# Altium project FluxWhisper.PrjPcb
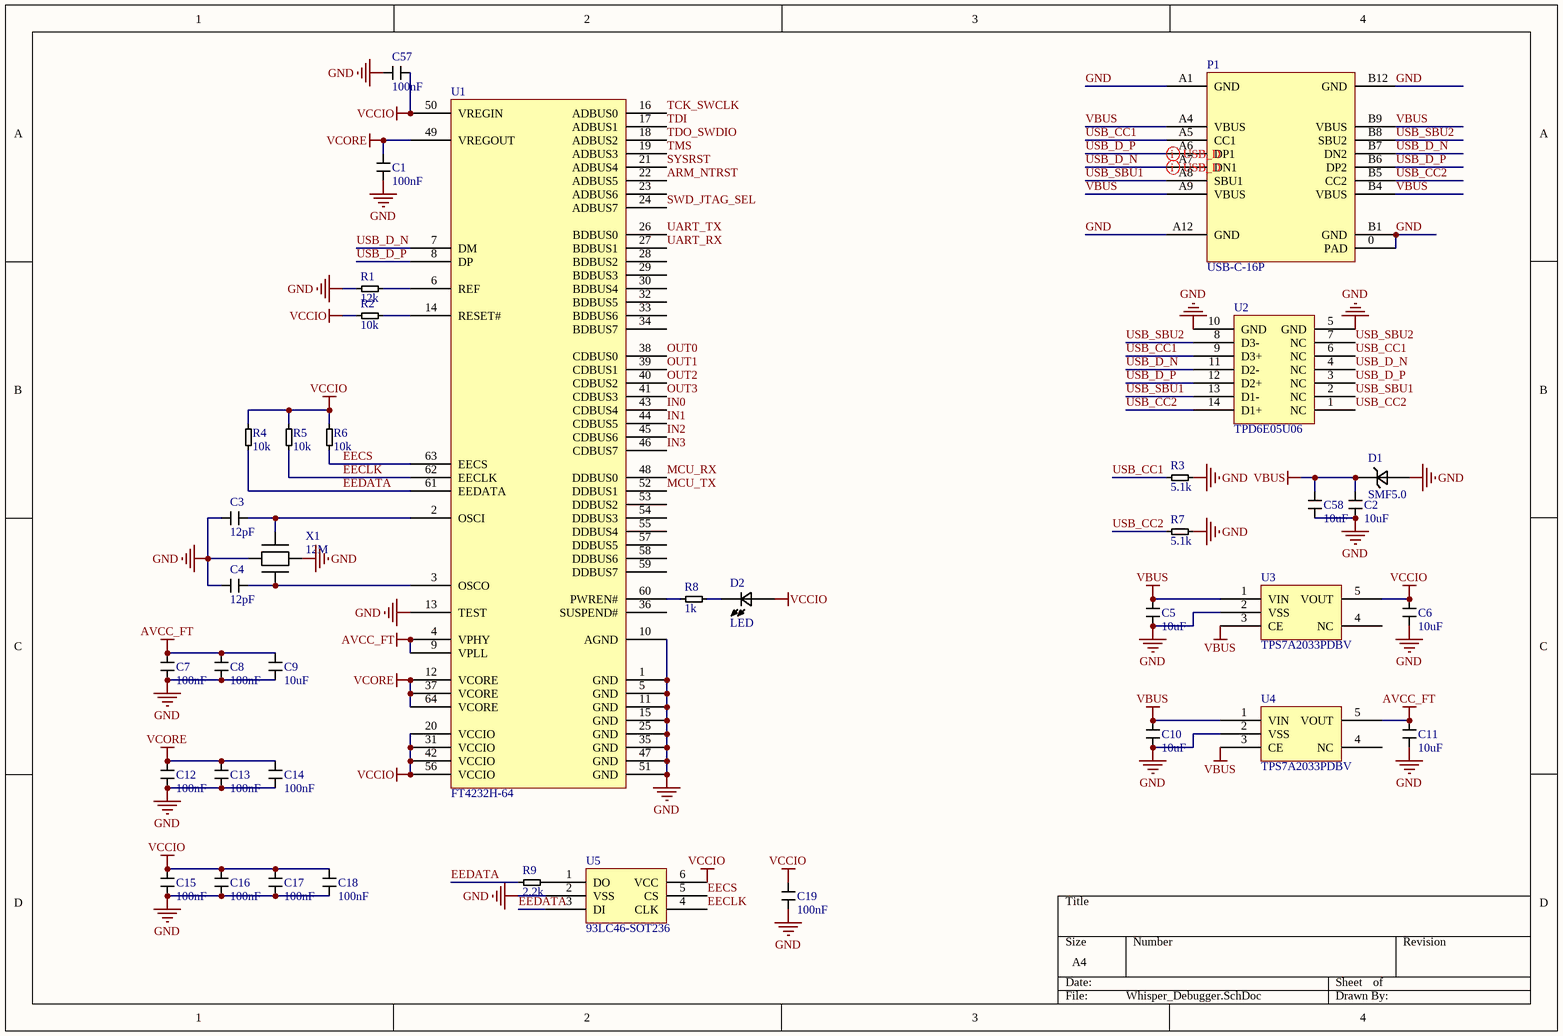
[diagram p0: Whisper_Debugger.SchDoc]
4 sheets, 209 parts. Net scope: global (net labels, ports and power ports of the same name join across sheets).
Board file: Whisper_pcb.PcbDoc
Sheets:
  Whisper_Debugger.SchDoc
  Whisper_Power.SchDoc
  Whisper_MCU.SchDoc
  Whisper_Ports.SchDoc

## Sheet Whisper_Debugger.SchDoc
size A4; SheetNumber: 1; SheetTotal: 4

### Parts
C1  100nF  [0603-Cap]
C2  10uF  [0603-Cap]
C3  12pF  [0603-Cap]
C4  12pF  [0603-Cap]
C5  10uF  [0603-Cap]
C6  10uF  [0603-Cap]
C7  100nF  [0603-Cap]
C8  100nF  [0603-Cap]
C9  10uF  [0603-Cap]
C10  10uF  [0603-Cap]
C11  10uF  [0603-Cap]
C12  100nF  [0603-Cap]
C13  100nF  [0603-Cap]
C14  100nF  [0603-Cap]
C15  100nF  [0603-Cap]
C16  100nF  [0603-Cap]
C17  100nF  [0603-Cap]
C18  100nF  [0603-Cap]
C19  100nF  [0603-Cap]
C57  100nF  [0603-Cap]
C58  10uF  [0603-Cap]
D1  SMF5.0  [SOD-123]
D2  LED  [0603-1]
P1  USB-C-16P  [USB-C-16P]
R1  12k  [0603]
R2  10k  [0603]
R3  5.1k  [0603]
R4  10k  [0603]
R5  10k  [0603]
R6  10k  [0603]
R7  5.1k  [0603]
R8  1k  [0603]
R9  2.2k  [0603]
U1  FT4232H-64  [LQFP-64]
U2  TPD6E05U06  [SON-14-RVZ]
U3  TPS7A2033PDBV  [SOT23-5]
U4  TPS7A2033PDBV  [SOT23-5]
U5  93LC46-SOT236  [SOT236]
X1  12M  [XTAL-3225-4P]

### Nets
AVCC_FT: C7.2 C8.2 C9.2 C11.2 U1.4(VPHY) U1.9(VPLL) U4.5(VOUT)
GND: C1.1 C2.1 C3.2 C4.2 C5.1 C6.1 C7.1 C8.1 C9.1 C10.1 C11.1 C12.1 C13.1 C14.1 C15.1 C16.1 C17.1 C18.1 C19.1 C57.2 C58.1 D1.1 P1.0(PAD) P1.A1(GND) P1.A12(GND) P1.B1(GND) P1.B12(GND) R1.2 R3.1 R7.1 U1.1(GND) U1.5(GND) U1.10(AGND) U1.11(GND) U1.13(TEST) U1.15(GND) U1.25(GND) U1.35(GND) U1.47(GND) U1.51(GND) U2.5(GND) U2.10(GND) U3.2(VSS) U4.2(VSS) U5.2(VSS) X1.2 X1.4
VBUS: C2.2 C5.2 C10.2 C58.2 D1.2 P1.A4(VBUS) P1.A9(VBUS) P1.B4(VBUS) P1.B9(VBUS) U3.1(VIN) U3.3(CE) U4.1(VIN) U4.3(CE)
VCCIO: C6.2 C15.2 C16.2 C17.2 C18.2 C19.2 C57.1 D2.1 R2.2 R4.1 R5.1 R6.1 U1.20(VCCIO) U1.31(VCCIO) U1.42(VCCIO) U1.50(VREGIN) U1.56(VCCIO) U3.5(VOUT) U5.6(VCC)
VCORE: C1.2 C12.2 C13.2 C14.2 U1.12(VCORE) U1.37(VCORE) U1.49(VREGOUT) U1.64(VCORE)
ARM_NTRST: U1.22(ADBUS5)
EECLK: R5.2 U1.62(EECLK) U5.4(CLK)
EECS: R6.2 U1.63(EECS) U5.5(CS)
EEDATA: R4.2 R9.2 U1.61(EEDATA) U5.3(DI)
IN0: U1.43(CDBUS4)
IN1: U1.44(CDBUS5)
IN2: U1.45(CDBUS6)
IN3: U1.46(CDBUS7)
MCU_RX: U1.48(DDBUS0)
MCU_TX: U1.52(DDBUS1)
OUT0: U1.38(CDBUS0)
OUT1: U1.39(CDBUS1)
OUT2: U1.40(CDBUS2)
OUT3: U1.41(CDBUS3)
SWD_JTAG_SEL: U1.24(ADBUS7)
SYSRST: U1.21(ADBUS4)
TCK_SWCLK: U1.16(ADBUS0)
TDI: U1.17(ADBUS1)
TDO_SWDIO: U1.18(ADBUS2)
TMS: U1.19(ADBUS3)
UART_RX: U1.27(BDBUS1)
UART_TX: U1.26(BDBUS0)
USB_CC1: P1.A5(CC1) R3.2 U2.6(NC) U2.9(D3+)
USB_CC2: P1.B5(CC2) R7.2 U2.1(NC) U2.14(D1+)
USB_D_N: P1.A7(DN1) P1.B7(DN2) U1.7(DM) U2.4(NC) U2.11(D2-)
USB_D_P: P1.A6(DP1) P1.B6(DP2) U1.8(DP) U2.3(NC) U2.12(D2+)
USB_SBU1: P1.A8(SBU1) U2.2(NC) U2.13(D1-)
USB_SBU2: P1.B8(SBU2) U2.7(NC) U2.8(D3-)
NetC3_1: C3.1 U1.2(OSCI) X1.3
NetC4_1: C4.1 U1.3(OSCO) X1.1
NetD2_2: D2.2 R8.1
NetR1_1: R1.1 U1.6(REF)
NetR2_1: R2.1 U1.14(RESET#)
NetR8_2: R8.2 U1.60(PWREN#)
NetR9_1: R9.1 U5.1(DO)

Not connected (* = marked no-connect by the designer): U1 23(ADBUS6) 28(BDBUS2) 29(BDBUS3) 30(BDBUS4) 32(BDBUS5) 33(BDBUS6) 34(BDBUS7) 36(SUSPEND#) 53(DDBUS2) 54(DDBUS3) 55(DDBUS4) 57(DDBUS5) 58(DDBUS6) 59(DDBUS7); U3 4(NC); U4 4(NC)

### Layout directives
differential pair: USB_D_N, USB_D_P

### Library data of the parts
C1-C4 C7-C9 C12-C19 C57 C58 = Cap
C5 C6 C10 C11 = Cap: CL10A475KA8NQNC
D1 = TVS
P1 = USB-C-16P: TYPE-C 16PIN 2MD(073)
R1-R9 = Res
U2 = TPD6E
U3 U4 = ME6211
X1 = XTAL-4LEAD

## Sheet Whisper_Power.SchDoc
size A4; SheetNumber: 2; SheetTotal: 4
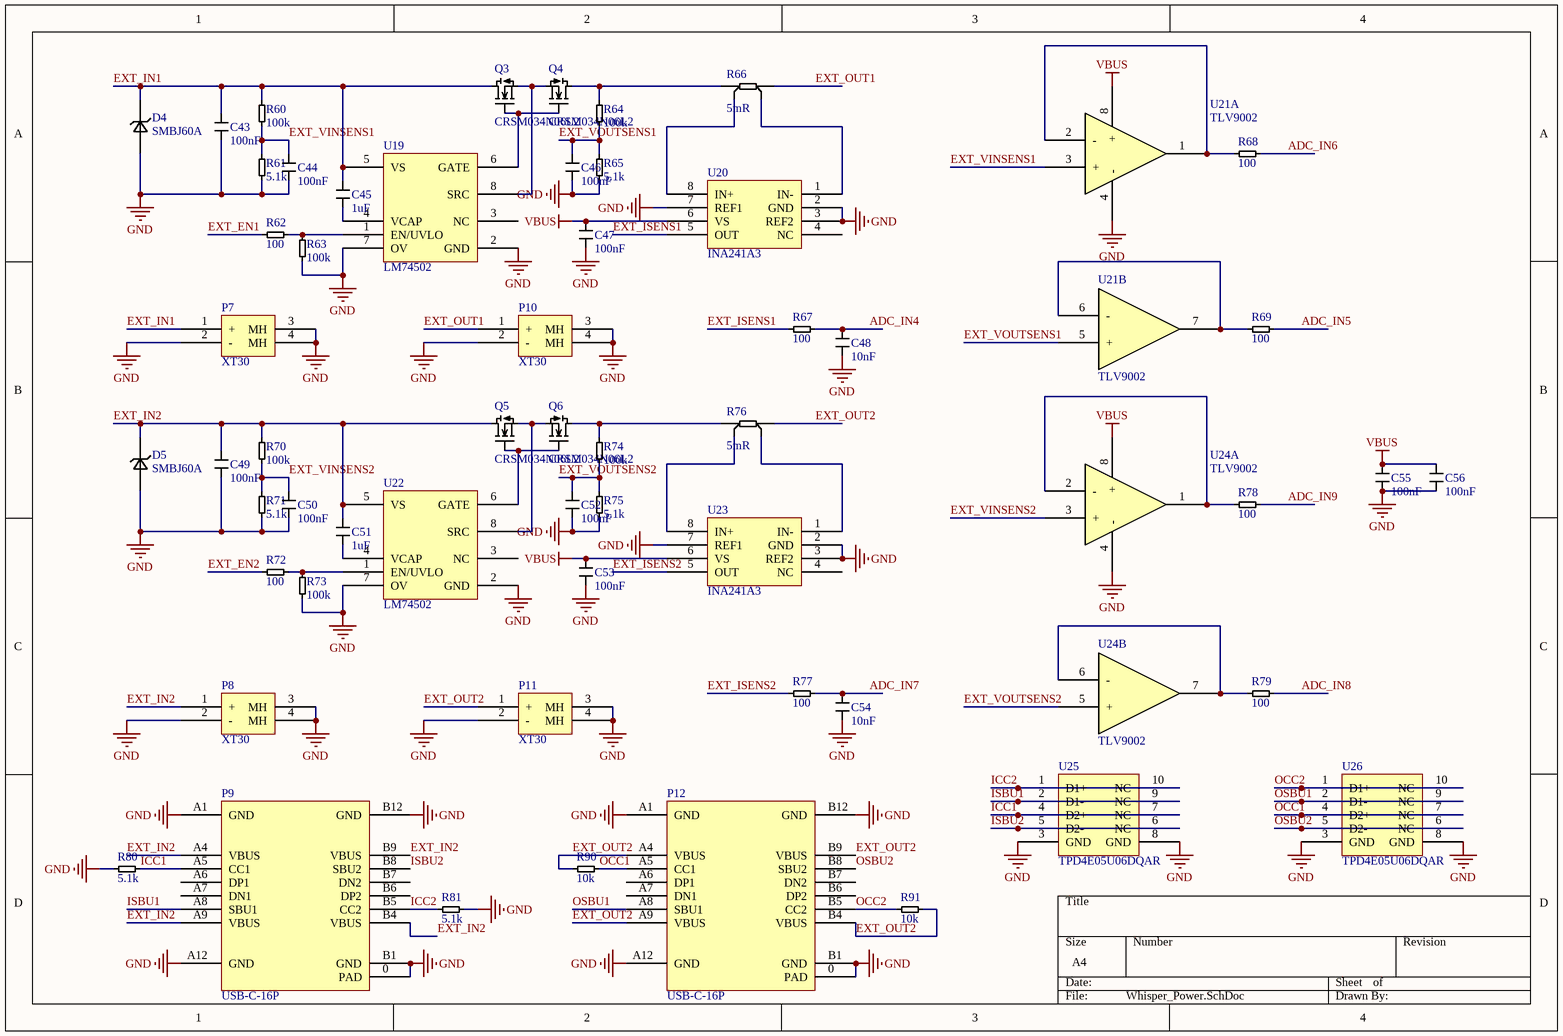
[diagram p1: Whisper_Power.SchDoc]

### Parts
C43  100nF  [0603-Cap]
C44  100nF  [0603-Cap]
C45  1uF  [0603-Cap]
C46  100nF  [0603-Cap]
C47  100nF  [0603-Cap]
C48  10nF  [0603-Cap]
C49  100nF  [0603-Cap]
C50  100nF  [0603-Cap]
C51  1uF  [0603-Cap]
C52  100nF  [0603-Cap]
C53  100nF  [0603-Cap]
C54  10nF  [0603-Cap]
C55  100nF  [0603-Cap]
C56  100nF  [0603-Cap]
D4  SMBJ60A  [SMB (DO-214AA)]
D5  SMBJ60A  [SMB (DO-214AA)]
P7  XT30  [XT30PW-M30]
P8  XT30  [XT30PW-M30]
P9  USB-C-16P  [USB-C-16P]
P10  XT30  [XT30PW-F30]
P11  XT30  [XT30PW-F30]
P12  USB-C-16P  [USB-C-16P]
Q3  CRSM034N06L2  [DFN5x6-MOS]
Q4  CRSM034N06L2  [DFN5x6-MOS]
Q5  CRSM034N06L2  [DFN5x6-MOS]
Q6  CRSM034N06L2  [DFN5x6-MOS]
R60  100k  [0603]
R61  5.1k  [0603]
R62  100  [0603]
R63  100k  [0603]
R64  100k  [0603]
R65  5.1k  [0603]
R66  5mR  [2512 - 4W]
R67  100  [0603]
R68  100  [0603]
R69  100  [0603]
R70  100k  [0603]
R71  5.1k  [0603]
R72  100  [0603]
R73  100k  [0603]
R74  100k  [0603]
R75  5.1k  [0603]
R76  5mR  [2512 - 4W]
R77  100  [0603]
R78  100  [0603]
R79  100  [0603]
R80  5.1k  [0603]
R81  5.1k  [0603]
R90  10k  [0603]
R91  10k  [0603]
U19  LM74502  [SOT23-8]
U20  INA241A3  [SOT23-8]
U21  TLV9002  [MSOP8]  (parts A,B of 2)
U22  LM74502  [SOT23-8]
U23  INA241A3  [SOT23-8]
U24  TLV9002  [MSOP8]  (parts A,B of 2)
U25  TPD4E05U06DQAR  [SON-10-DQA]
U26  TPD4E05U06DQAR  [SON-10-DQA]

### Nets
GND: C43.1 C44.1 C46.1 C47.1 C48.1 C49.1 C50.1 C52.1 C53.1 C54.1 C55.1 C56.1 D4.1 D5.1 P7.2(-) P7.3(MH) P7.4(MH) P8.2(-) P8.3(MH) P8.4(MH) P9.0(PAD) P9.A1(GND) P9.A12(GND) P9.B1(GND) P9.B12(GND) P10.2(-) P10.3(MH) P10.4(MH) P11.2(-) P11.3(MH) P11.4(MH) P12.0(PAD) P12.A1(GND) P12.A12(GND) P12.B1(GND) P12.B12(GND) R61.2 R63.2 R65.2 R71.2 R73.2 R75.2 R80.1 R81.1 U19.2(GND) U19.7(OV) U20.2(GND) U20.3(REF2) U20.7(REF1) U21.4(-) U22.2(GND) U22.7(OV) U23.2(GND) U23.3(REF2) U23.7(REF1) U24.4(-) U25.3(GND) U25.8(GND) U26.3(GND) U26.8(GND)
VBUS: C47.2 C53.2 C55.2 C56.2 U20.6(VS) U21.8(+) U23.6(VS) U24.8(+)
ADC_IN4: C48.2 R67.1
ADC_IN5: R69.1
ADC_IN6: R68.1
ADC_IN7: C54.2 R77.1
ADC_IN8: R79.1
ADC_IN9: R78.1
EXT_EN1: R62.1
EXT_EN2: R72.1
EXT_IN1: C43.2 C45.2 D4.2 P7.1(+) Q3.3(D) R60.1 U19.5(VS)
EXT_IN2: C49.2 C51.2 D5.2 P8.1(+) P9.A4(VBUS) P9.A9(VBUS) P9.B4(VBUS) P9.B9(VBUS) Q5.3(D) R70.1 U22.5(VS)
EXT_ISENS1: R67.2 U20.5(OUT)
EXT_ISENS2: R77.2 U23.5(OUT)
EXT_OUT1: P10.1(+) R66.2
EXT_OUT2: P11.1(+) P12.A4(VBUS) P12.A9(VBUS) P12.B4(VBUS) P12.B9(VBUS) R76.2 R90.2 R91.1
EXT_VINSENS1: C44.2 R60.2 R61.1 U21.3(+)
EXT_VINSENS2: C50.2 R70.2 R71.1 U24.3(+)
EXT_VOUTSENS1: C46.2 R64.2 R65.1 U21.5(+)
EXT_VOUTSENS2: C52.2 R74.2 R75.1 U24.5(+)
ICC1: P9.A5(CC1) R80.2 U25.4(D2+) U25.7(NC)
ICC2: P9.B5(CC2) R81.2 U25.1(D1+) U25.10(NC)
ISBU1: P9.A8(SBU1) U25.2(D1-) U25.9(NC)
ISBU2: P9.B8(SBU2) U25.5(D2-) U25.6(NC)
OCC1: P12.A5(CC1) R90.1 U26.4(D2+) U26.7(NC)
OCC2: P12.B5(CC2) R91.2 U26.1(D1+) U26.10(NC)
OSBU1: P12.A8(SBU1) U26.2(D1-) U26.9(NC)
OSBU2: P12.B8(SBU2) U26.5(D2-) U26.6(NC)
NetC45_1: C45.1 U19.4(VCAP)
NetC51_1: C51.1 U22.4(VCAP)
NetQ3_1: Q3.1(G) Q4.1(G) U19.6(GATE)
NetQ3_2: Q3.2(S) Q4.2(S) U19.8(SRC)
NetQ4_3: Q4.3(D) R64.1 R66.1
NetQ5_1: Q5.1(G) Q6.1(G) U22.6(GATE)
NetQ5_2: Q5.2(S) Q6.2(S) U22.8(SRC)
NetQ6_3: Q6.3(D) R74.1 R76.1
NetR62_2: R62.2 R63.1 U19.1(EN/UVLO)
NetR66_3: R66.3 U20.8(IN+)
NetR66_4: R66.4 U20.1(IN-)
NetR68_2: R68.2 U21.1 U21.2(-)
NetR69_2: R69.2 U21.6(-) U21.7
NetR72_2: R72.2 R73.1 U22.1(EN/UVLO)
NetR76_3: R76.3 U23.8(IN+)
NetR76_4: R76.4 U23.1(IN-)
NetR78_2: R78.2 U24.1 U24.2(-)
NetR79_2: R79.2 U24.6(-) U24.7

Not connected (* = marked no-connect by the designer): P9 A6(DP1) A7(DN1) B6(DP2) B7(DN2); P12 A6(DP1) A7(DN1) B6(DP2) B7(DN2); U19 3(NC); U20 4(NC); U22 3(NC); U23 4(NC)

### Library data of the parts
C43-C56 = Cap
D4 D5 = TVS
P9 P12 = USB-C-16P: TYPE-C 16PIN 2MD(073)
Q3-Q6 = NMOS-D: C467174
R60-R65 R67-R75 R77-R81 R90 R91 = Res
R66 R76 = RES-4W
U20 U23 = INA241
U21 U24 = ADA4077-2
U25 U26 = TPD4E

## Sheet Whisper_MCU.SchDoc
size A4; SheetNumber: 3; SheetTotal: 4
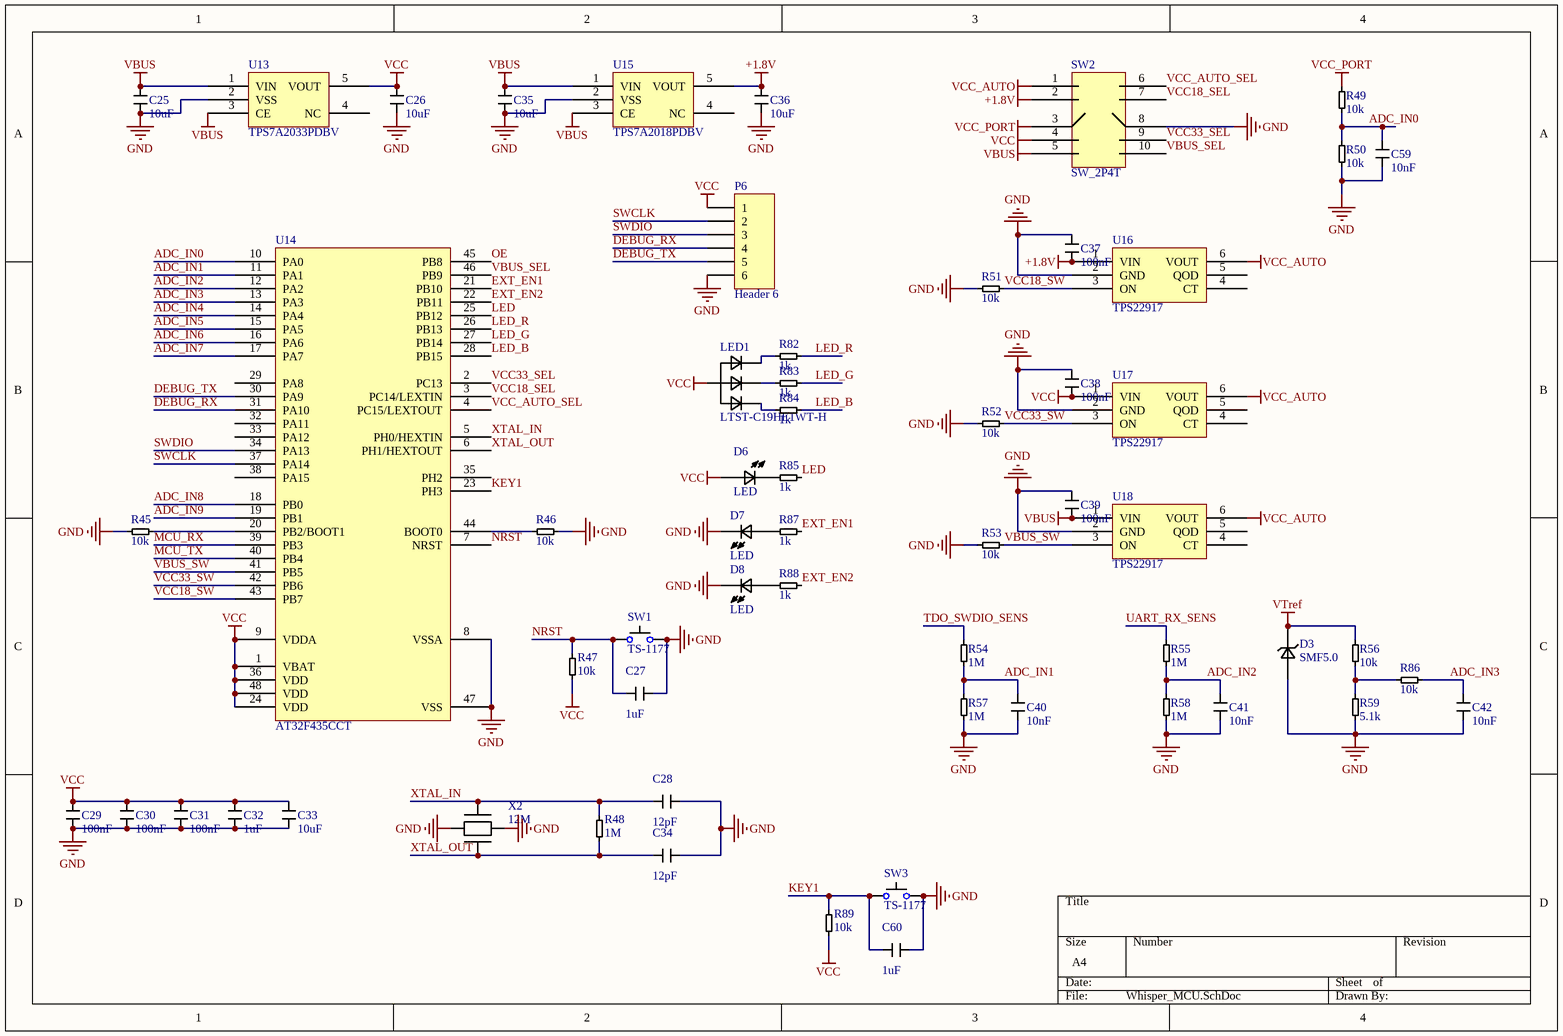
[diagram p2: Whisper_MCU.SchDoc]

### Parts
C25  10uF  [0603-Cap]
C26  10uF  [0603-Cap]
C27  1uF  [0603-Cap]
C28  12pF  [0603-Cap]
C29  100nF  [0603-Cap]
C30  100nF  [0603-Cap]
C31  100nF  [0603-Cap]
C32  1uF  [0603-Cap]
C33  10uF  [0603-Cap]
C34  12pF  [0603-Cap]
C35  10uF  [0603-Cap]
C36  10uF  [0603-Cap]
C37  100nF  [0603-Cap]
C38  100nF  [0603-Cap]
C39  100nF  [0603-Cap]
C40  10nF  [0603-Cap]
C41  10nF  [0603-Cap]
C42  10nF  [0603-Cap]
C59  10nF  [0603-Cap]
C60  1uF  [0603-Cap]
D3  SMF5.0  [SOD-123]
D6  LED  [0603-1]
D7  LED  [0603-1]
D8  LED  [0603-1]
LED1  LTST-C19HE1WT-H  [RGB1.6*1.6]
P6  Header 6  [HDR1X6]
R45  10k  [0603]
R46  10k  [0603]
R47  10k  [0603]
R48  1M  [0603]
R49  10k  [0603]
R50  10k  [0603]
R51  10k  [0603]
R52  10k  [0603]
R53  10k  [0603]
R54  1M  [0603]
R55  1M  [0603]
R56  10k  [0603]
R57  1M  [0603]
R58  1M  [0603]
R59  5.1k  [0603]
R82  1k  [0603]
R83  1k  [0603]
R84  1k  [0603]
R85  1k  [0603]
R86  10k  [0603]
R87  1k  [0603]
R88  1k  [0603]
R89  10k  [0603]
SW1  TS-1177  [BTN3*3]
SW2  SW_2P4T  [SW-SS-3456S-02-L1]
SW3  TS-1177  [BTN3*3]
U13  TPS7A2033PDBV  [SOT23-5]
U14  AT32F435CCT  [LQFP-48]
U15  TPS7A2018PDBV  [SOT23-5]
U16  TPS22917  [SOT236]
U17  TPS22917  [SOT236]
U18  TPS22917  [SOT236]
X2  12M  [XTAL-3225-4P]

### Nets
+1.8V: C36.2 C37.1 SW2.2 U15.5(VOUT) U16.1(VIN)
GND: C25.1 C26.1 C27.1 C28.1 C29.1 C30.1 C31.1 C32.1 C33.1 C34.1 C35.1 C36.1 C37.2 C38.2 C39.2 C40.2 C41.2 C42.2 C59.2 C60.1 D3.1 D7.2 D8.2 P6.6 R45.2 R46.2 R50.1 R51.2 R52.2 R53.2 R57.1 R58.1 R59.1 SW1.2 SW2.8 SW3.2 U13.2(VSS) U14.8(VSSA) U14.47(VSS) U15.2(VSS) U16.2(GND) U17.2(GND) U18.2(GND) X2.2 X2.4
VBUS: C25.2 C35.2 C39.1 SW2.5 U13.1(VIN) U13.3(CE) U15.1(VIN) U15.3(CE) U18.1(VIN)
VCC: C26.2 C29.2 C30.2 C31.2 C32.2 C33.2 C38.1 D6.1 LED1.4 P6.1 R47.1 R89.1 SW2.4 U13.5(VOUT) U14.1(VBAT) U14.9(VDDA) U14.24(VDD) U14.36(VDD) U14.48(VDD) U17.1(VIN)
VCC_AUTO: SW2.1 U16.6(VOUT) U17.6(VOUT) U18.6(VOUT)
VCC_PORT: R49.2 SW2.3
VTref: D3.2 R56.2
ADC_IN0: C59.1 R49.1 R50.2 U14.10(PA0)
ADC_IN1: C40.1 R54.1 R57.2 U14.11(PA1)
ADC_IN2: C41.1 R55.1 R58.2 U14.12(PA2)
ADC_IN3: C42.1 R86.1 U14.13(PA3)
ADC_IN4: U14.14(PA4)
ADC_IN5: U14.15(PA5)
ADC_IN6: U14.16(PA6)
ADC_IN7: U14.17(PA7)
ADC_IN8: U14.18(PB0)
ADC_IN9: U14.19(PB1)
DEBUG_RX: P6.4 U14.31(PA10)
DEBUG_TX: P6.5 U14.30(PA9)
EXT_EN1: R87.2 U14.21(PB10)
EXT_EN2: R88.2 U14.22(PB11)
KEY1: C60.2 R89.2 SW3.1 U14.23(PH3)
LED: R85.2 U14.25(PB12)
LED_B: R84.2 U14.28(PB15)
LED_G: R83.2 U14.27(PB14)
LED_R: R82.2 U14.26(PB13)
MCU_RX: U14.39(PB3)
MCU_TX: U14.40(PB4)
NRST: C27.2 R47.2 SW1.1 U14.7(NRST)
OE: U14.45(PB8)
SWCLK: P6.2 U14.37(PA14)
SWDIO: P6.3 U14.34(PA13)
TDO_SWDIO_SENS: R54.2
UART_RX_SENS: R55.2
VBUS_SEL: SW2.10 U14.46(PB9)
VBUS_SW: R53.1 U14.41(PB5) U18.3(ON)
VCC18_SEL: SW2.7 U14.3(PC14/LEXTIN)
VCC18_SW: R51.1 U14.43(PB7) U16.3(ON)
VCC33_SEL: SW2.9 U14.2(PC13)
VCC33_SW: R52.1 U14.42(PB6) U17.3(ON)
VCC_AUTO_SEL: SW2.6 U14.4(PC15/LEXTOUT)
XTAL_IN: C28.2 R48.2 U14.5(PH0/HEXTIN) X2.3
XTAL_OUT: C34.2 R48.1 U14.6(PH1/HEXTOUT) X2.1
NetD6_2: D6.2 R85.1
NetD7_1: D7.1 R87.1
NetD8_1: D8.1 R88.1
NetLED1_1: LED1.1 R82.1
NetLED1_2: LED1.2 R83.1
NetLED1_3: LED1.3 R84.1
NetR45_1: R45.1 U14.20(PB2/BOOT1)
NetR46_1: R46.1 U14.44(BOOT0)
NetR56_1: R56.1 R59.2 R86.2

Not connected (* = marked no-connect by the designer): U13 4(NC); U14 29(PA8) 32(PA11) 33(PA12) 35(PH2) 38(PA15); U15 4(NC); U16 4(CT) 5(QOD); U17 4(CT) 5(QOD); U18 4(CT) 5(QOD)

### Library data of the parts
C25 C26 C35 C36 = Cap: CL10A475KA8NQNC
C27-C34 C37-C42 C59 C60 = Cap
D3 = TVS
LED1 = RGB_CA: C427425
P6 = Header 6: Header, 6-Pin; LatestRevisionDate: 17-Jul-2002; LatestRevisionNote: Re-released for DXP Platform.; Publisher: Altium Limited
R45-R59 R82-R89 = Res
SW1 SW3 = Btn: C561512
U13 U15 = ME6211
U14 = AT32F435CxT
X2 = XTAL-4LEAD

## Sheet Whisper_Ports.SchDoc
size A4; SheetNumber: 4; SheetTotal: 4
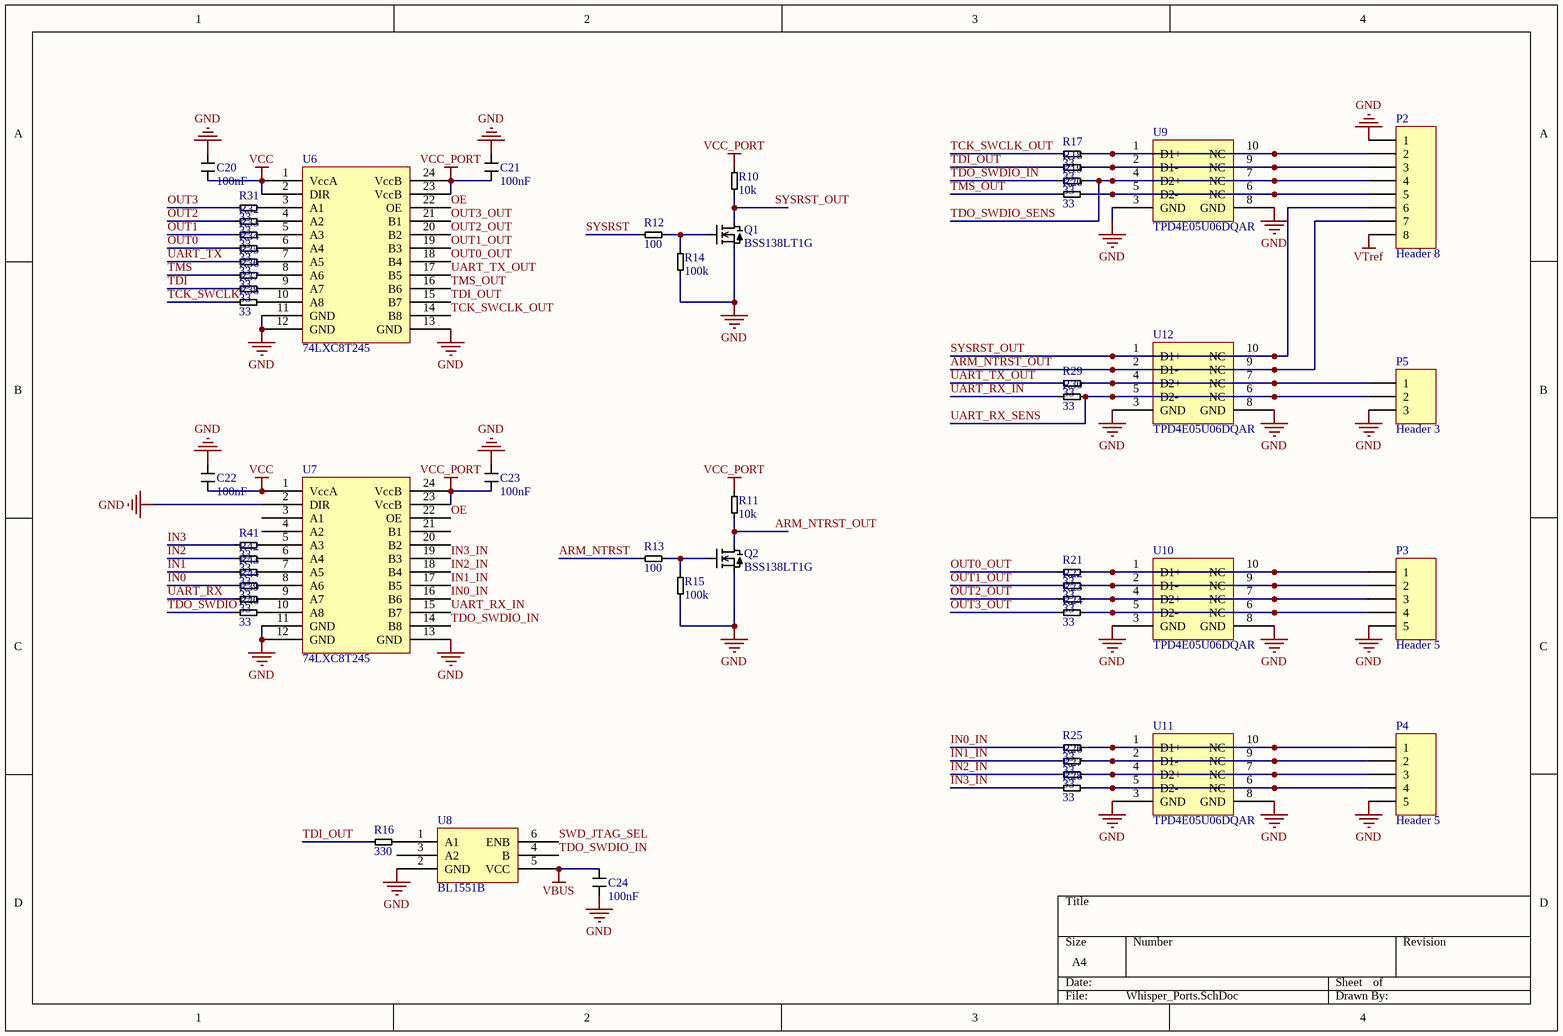
[diagram p3: Whisper_Ports.SchDoc]

### Parts
C20  100nF  [0603-Cap]
C21  100nF  [0603-Cap]
C22  100nF  [0603-Cap]
C23  100nF  [0603-Cap]
C24  100nF  [0603-Cap]
P2  Header 8  [HDR1X8]
P3  Header 5  [HDR1X5]
P4  Header 5  [HDR1X5]
P5  Header 3  [HDR1X3]
Q1  BSS138LT1G  [SOT23]
Q2  BSS138LT1G  [SOT23]
R10  10k  [0603]
R11  10k  [0603]
R12  100  [0603]
R13  100  [0603]
R14  100k  [0603]
R15  100k  [0603]
R16  330  [0603]
R17  33  [0603]
R18  33  [0603]
R19  33  [0603]
R20  33  [0603]
R21  33  [0603]
R22  33  [0603]
R23  33  [0603]
R24  33  [0603]
R25  33  [0603]
R26  33  [0603]
R27  33  [0603]
R28  33  [0603]
R29  33  [0603]
R30  33  [0603]
R31  33  [0603]
R32  33  [0603]
R33  33  [0603]
R34  33  [0603]
R35  33  [0603]
R36  33  [0603]
R37  33  [0603]
R38  33  [0603]
R39  33  [0603]
R40  33  [0603]
R41  33  [0603]
R42  33  [0603]
R43  33  [0603]
R44  33  [0603]
U6  74LXC8T245  [TSSOP-24]
U7  74LXC8T245  [TSSOP-24]
U8  BL1551B  [SC70]
U9  TPD4E05U06DQAR  [SON-10-DQA]
U10  TPD4E05U06DQAR  [SON-10-DQA]
U11  TPD4E05U06DQAR  [SON-10-DQA]
U12  TPD4E05U06DQAR  [SON-10-DQA]

### Nets
GND: C20.1 C21.2 C22.1 C23.2 C24.2 P2.1 P3.5 P4.5 P5.3 Q1.2(S) Q2.2(S) R14.1 R15.1 U6.11(GND) U6.12(GND) U6.13(GND) U7.2(DIR) U7.11(GND) U7.12(GND) U7.13(GND) U8.2(GND) U9.3(GND) U9.8(GND) U10.3(GND) U10.8(GND) U11.3(GND) U11.8(GND) U12.3(GND) U12.8(GND)
VBUS: C24.1 U8.5(VCC)
VCC: C20.2 C22.2 U6.1(VccA) U6.2(DIR) U7.1(VccA)
VCC_PORT: C21.1 C23.1 R10.2 R11.2 U6.23(VccB) U6.24(VccB) U7.23(VccB) U7.24(VccB)
VTref: P2.8
ARM_NTRST: R13.1
ARM_NTRST_OUT: P2.7 Q2.3(D) R11.1 U12.2(D1-) U12.9(NC)
IN0: R44.1
IN0_IN: R25.1 U7.16(B6)
IN1: R43.1
IN1_IN: R26.1 U7.17(B5)
IN2: R42.1
IN2_IN: R27.1 U7.18(B4)
IN3: R41.1
IN3_IN: R28.1 U7.19(B3)
OE: U6.22(OE) U7.22(OE)
OUT0: R34.1
OUT0_OUT: R21.1 U6.18(B4)
OUT1: R33.1
OUT1_OUT: R22.1 U6.19(B3)
OUT2: R32.1
OUT2_OUT: R23.1 U6.20(B2)
OUT3: R31.1
OUT3_OUT: R24.1 U6.21(B1)
SWD_JTAG_SEL: U8.6(ENB)
SYSRST: R12.1
SYSRST_OUT: P2.6 Q1.3(D) R10.1 U12.1(D1+) U12.10(NC)
TCK_SWCLK: R38.1
TCK_SWCLK_OUT: R17.1 U6.14(B8)
TDI: R37.1
TDI_OUT: R16.1 R18.1 U6.15(B7)
TDO_SWDIO: R40.1
TDO_SWDIO_IN: R19.1 U7.14(B8) U8.4(B)
TDO_SWDIO_SENS: P2.4 R19.2 U9.4(D2+) U9.7(NC)
TMS: R36.1
TMS_OUT: R20.1 U6.16(B6)
UART_RX: R39.1
UART_RX_IN: R30.1 U7.15(B7)
UART_RX_SENS: P5.2 R30.2 U12.5(D2-) U12.6(NC)
UART_TX: R35.1
UART_TX_OUT: R29.1 U6.17(B5)
NetP2_2: P2.2 R17.2 U9.1(D1+) U9.10(NC)
NetP2_3: P2.3 R18.2 U9.2(D1-) U9.9(NC)
NetP2_5: P2.5 R20.2 U9.5(D2-) U9.6(NC)
NetP3_1: P3.1 R21.2 U10.1(D1+) U10.10(NC)
NetP3_2: P3.2 R22.2 U10.2(D1-) U10.9(NC)
NetP3_3: P3.3 R23.2 U10.4(D2+) U10.7(NC)
NetP3_4: P3.4 R24.2 U10.5(D2-) U10.6(NC)
NetP4_1: P4.1 R25.2 U11.1(D1+) U11.10(NC)
NetP4_2: P4.2 R26.2 U11.2(D1-) U11.9(NC)
NetP4_3: P4.3 R27.2 U11.4(D2+) U11.7(NC)
NetP4_4: P4.4 R28.2 U11.5(D2-) U11.6(NC)
NetP5_1: P5.1 R29.2 U12.4(D2+) U12.7(NC)
NetQ1_1: Q1.1(G) R12.2 R14.2
NetQ2_1: Q2.1(G) R13.2 R15.2
NetR16_2: R16.2 U8.1(A1)
NetR31_2: R31.2 U6.3(A1)
NetR32_2: R32.2 U6.4(A2)
NetR33_2: R33.2 U6.5(A3)
NetR34_2: R34.2 U6.6(A4)
NetR35_2: R35.2 U6.7(A5)
NetR36_2: R36.2 U6.8(A6)
NetR37_2: R37.2 U6.9(A7)
NetR38_2: R38.2 U6.10(A8)
NetR39_2: R39.2 U7.9(A7)
NetR40_2: R40.2 U7.10(A8)
NetR41_2: R41.2 U7.5(A3)
NetR42_2: R42.2 U7.6(A4)
NetR43_2: R43.2 U7.7(A5)
NetR44_2: R44.2 U7.8(A6)

Not connected (* = marked no-connect by the designer): U7 3(A1) 4(A2) 20(B2) 21(B1); U8 3(A2)

### Library data of the parts
C20-C24 = Cap
P2 = Header 8: Header, 8-Pin; LatestRevisionDate: 17-Jul-2002; LatestRevisionNote: Re-released for DXP Platform.; Publisher: Altium Limited
P3 P4 = Header 5: Header, 5-Pin; LatestRevisionDate: 17-Jul-2002; LatestRevisionNote: Re-released for DXP Platform.; Publisher: Altium Limited
P5 = Header 3: Header, 3-Pin; LatestRevisionDate: 17-Jul-2002; LatestRevisionNote: Re-released for DXP Platform.; Publisher: Altium Limited
Q1 Q2 = NMOS-D
R10-R44 = Res
U9-U12 = TPD4E

## Nets that join several sheets
GND: Whisper_Debugger (47 pins), Whisper_Power (60 pins), Whisper_MCU (45 pins), Whisper_Ports (29 pins)
VBUS: Whisper_Debugger (13 pins), Whisper_Power (8 pins), Whisper_MCU (9 pins), Whisper_Ports (C24.1 U8.5)
VCC: Whisper_MCU (20 pins), Whisper_Ports (5 pins)
VCC_PORT: Whisper_MCU (R49.2 SW2.3), Whisper_Ports (8 pins)
VTref: Whisper_MCU (D3.2 R56.2), Whisper_Ports (P2.8)
ADC_IN4: Whisper_Power (C48.2 R67.1), Whisper_MCU (U14.14)
ADC_IN5: Whisper_Power (R69.1), Whisper_MCU (U14.15)
ADC_IN6: Whisper_Power (R68.1), Whisper_MCU (U14.16)
ADC_IN7: Whisper_Power (C54.2 R77.1), Whisper_MCU (U14.17)
ADC_IN8: Whisper_Power (R79.1), Whisper_MCU (U14.18)
ADC_IN9: Whisper_Power (R78.1), Whisper_MCU (U14.19)
ARM_NTRST: Whisper_Debugger (U1.22), Whisper_Ports (R13.1)
EXT_EN1: Whisper_Power (R62.1), Whisper_MCU (R87.2 U14.21)
EXT_EN2: Whisper_Power (R72.1), Whisper_MCU (R88.2 U14.22)
IN0: Whisper_Debugger (U1.43), Whisper_Ports (R44.1)
IN1: Whisper_Debugger (U1.44), Whisper_Ports (R43.1)
IN2: Whisper_Debugger (U1.45), Whisper_Ports (R42.1)
IN3: Whisper_Debugger (U1.46), Whisper_Ports (R41.1)
MCU_RX: Whisper_Debugger (U1.48), Whisper_MCU (U14.39)
MCU_TX: Whisper_Debugger (U1.52), Whisper_MCU (U14.40)
OE: Whisper_MCU (U14.45), Whisper_Ports (U6.22 U7.22)
OUT0: Whisper_Debugger (U1.38), Whisper_Ports (R34.1)
OUT1: Whisper_Debugger (U1.39), Whisper_Ports (R33.1)
OUT2: Whisper_Debugger (U1.40), Whisper_Ports (R32.1)
OUT3: Whisper_Debugger (U1.41), Whisper_Ports (R31.1)
SWD_JTAG_SEL: Whisper_Debugger (U1.24), Whisper_Ports (U8.6)
SYSRST: Whisper_Debugger (U1.21), Whisper_Ports (R12.1)
TCK_SWCLK: Whisper_Debugger (U1.16), Whisper_Ports (R38.1)
TDI: Whisper_Debugger (U1.17), Whisper_Ports (R37.1)
TDO_SWDIO: Whisper_Debugger (U1.18), Whisper_Ports (R40.1)
TDO_SWDIO_SENS: Whisper_MCU (R54.2), Whisper_Ports (P2.4 R19.2 U9.4 U9.7)
TMS: Whisper_Debugger (U1.19), Whisper_Ports (R36.1)
UART_RX: Whisper_Debugger (U1.27), Whisper_Ports (R39.1)
UART_RX_SENS: Whisper_MCU (R55.2), Whisper_Ports (P5.2 R30.2 U12.5 U12.6)
UART_TX: Whisper_Debugger (U1.26), Whisper_Ports (R35.1)